# Altium project ODOS_PCB_Payload.PrjPcb
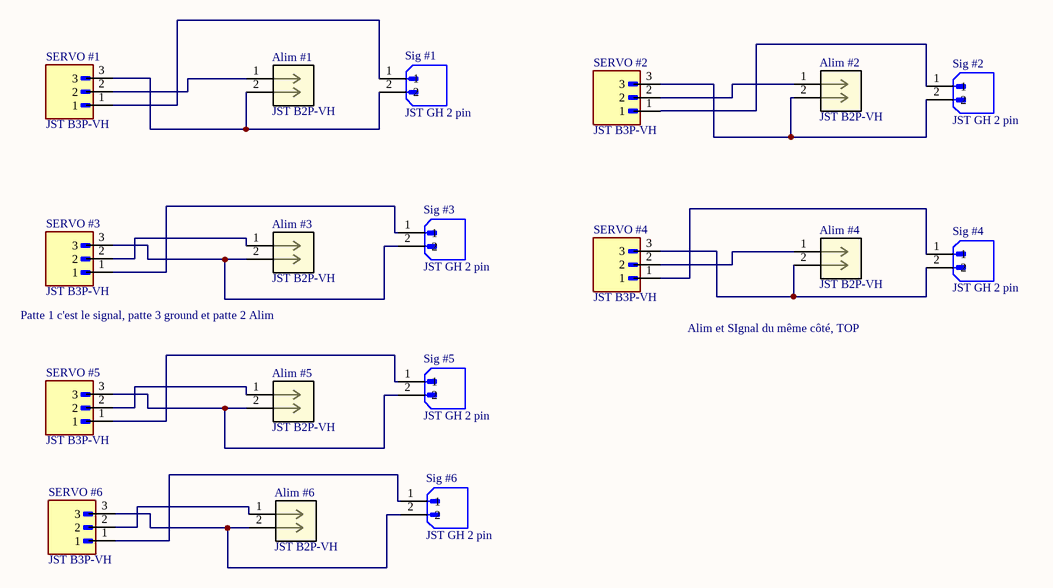
[diagram p0: ODOS_PCB_Payload_schem.SchDoc]
1 sheet, 18 parts. Net scope: global (net labels, ports and power ports of the same name join across sheets).
Board file: ODOS_PCB_Payload_pcb.PcbDoc

## Sheet ODOS_PCB_Payload_schem.SchDoc
size A; SheetNumber: 1; SheetTotal: 1

### Parts
Alim_#1  JST B2P-VH  [CONN_B2P-VH_JST]
Alim_#2  JST B2P-VH  [CONN_B2P-VH_JST]
Alim_#3  JST B2P-VH  [CONN_B2P-VH_JST]
Alim_#4  JST B2P-VH  [CONN_B2P-VH_JST]
Alim_#5  JST B2P-VH  [CONN_B2P-VH_JST]
Alim_#6  JST B2P-VH  [CONN_B2P-VH_JST]
SERVO_#1  JST B3P-VH  [JST_B3P-VH(LF)(SN)]
SERVO_#2  JST B3P-VH  [JST_B3P-VH(LF)(SN)]
SERVO_#3  JST B3P-VH  [JST_B3P-VH(LF)(SN)]
SERVO_#4  JST B3P-VH  [JST_B3P-VH(LF)(SN)]
SERVO_#5  JST B3P-VH  [JST_B3P-VH(LF)(SN)]
SERVO_#6  JST B3P-VH  [JST_B3P-VH(LF)(SN)]
Sig_#1  JST GH 2 pin  [JST_BM02B-GHS-TBT(LF)(SN)]
Sig_#2  JST GH 2 pin  [JST_BM02B-GHS-TBT(LF)(SN)]
Sig_#3  JST GH 2 pin  [JST_BM02B-GHS-TBT(LF)(SN)]
Sig_#4  JST GH 2 pin  [JST_BM02B-GHS-TBT(LF)(SN)]
Sig_#5  JST GH 2 pin  [JST_BM02B-GHS-TBT(LF)(SN)]
Sig_#6  JST GH 2 pin  [JST_BM02B-GHS-TBT(LF)(SN)]

### Nets
NetAlim_#1_1: Alim_#1.1 SERVO_#1.2
NetAlim_#1_2: Alim_#1.2 SERVO_#1.3 Sig_#1.2
NetAlim_#2_1: Alim_#2.1 SERVO_#2.2
NetAlim_#2_2: Alim_#2.2 SERVO_#2.3 Sig_#2.2
NetAlim_#3_1: Alim_#3.1 SERVO_#3.2
NetAlim_#3_2: Alim_#3.2 SERVO_#3.3 Sig_#3.2
NetAlim_#4_1: Alim_#4.1 SERVO_#4.2
NetAlim_#4_2: Alim_#4.2 SERVO_#4.3 Sig_#4.2
NetAlim_#5_1: Alim_#5.1 SERVO_#5.2
NetAlim_#5_2: Alim_#5.2 SERVO_#5.3 Sig_#5.2
NetAlim_#6_1: Alim_#6.1 SERVO_#6.2
NetAlim_#6_2: Alim_#6.2 SERVO_#6.3 Sig_#6.2
NetSERVO_#1_1: SERVO_#1.1 Sig_#1.1
NetSERVO_#2_1: SERVO_#2.1 Sig_#2.1
NetSERVO_#3_1: SERVO_#3.1 Sig_#3.1
NetSERVO_#4_1: SERVO_#4.1 Sig_#4.1
NetSERVO_#5_1: SERVO_#5.1 Sig_#5.1
NetSERVO_#6_1: SERVO_#6.1 Sig_#6.1

### Notes on the sheet
- Patte 1 c'est le signal, patte 3 ground et patte 2 Alim
- Alim et SIgnal du même côté, TOP

### Library data of the parts
Alim_#1-Alim_#6 = B2P-VHLFSN: JST VH 2 pin; Manufacturer_Part_Number: B2P-VH(LF)(SN); Copyright: Copyright (C) 2025 Ultra Librarian. All rights reserved.; Manufacturer_Name: JST; RefDes: RefDes; Type: Type
SERVO_#1-SERVO_#6 = B3P-VH(LF)(SN): JST VH 3 PIN; MF: JST Sales; SnapEDA_Link: https://www.snapeda.com/parts/B3P-VH(LF)(SN)/JST/view-part/?ref=snap; Package: None; Value: *; MP: B3P-VH(LF)(SN); Check_prices: https://www.snapeda.com/parts/B3P-VH(LF)(SN)/JST/view-part/?ref=eda
Sig_#1-Sig_#6 = BM02B-GHS-TBT(LF)(SN): Connector Header Surface Mount 2 position 0.049 (1.25mm); MF: JST Sales; SnapEDA_Link: https://www.snapeda.com/parts/BM02B-GHS-TBT%20(LF)(SN)/JST/view-part/?ref=snap; Package: None; Value: *; MP: BM02B-GHS-TBT (LF)(SN); Check_prices: https://www.snapeda.com/parts/BM02B-GHS-TBT%20(LF)(SN)/JST/view-part/?ref=eda